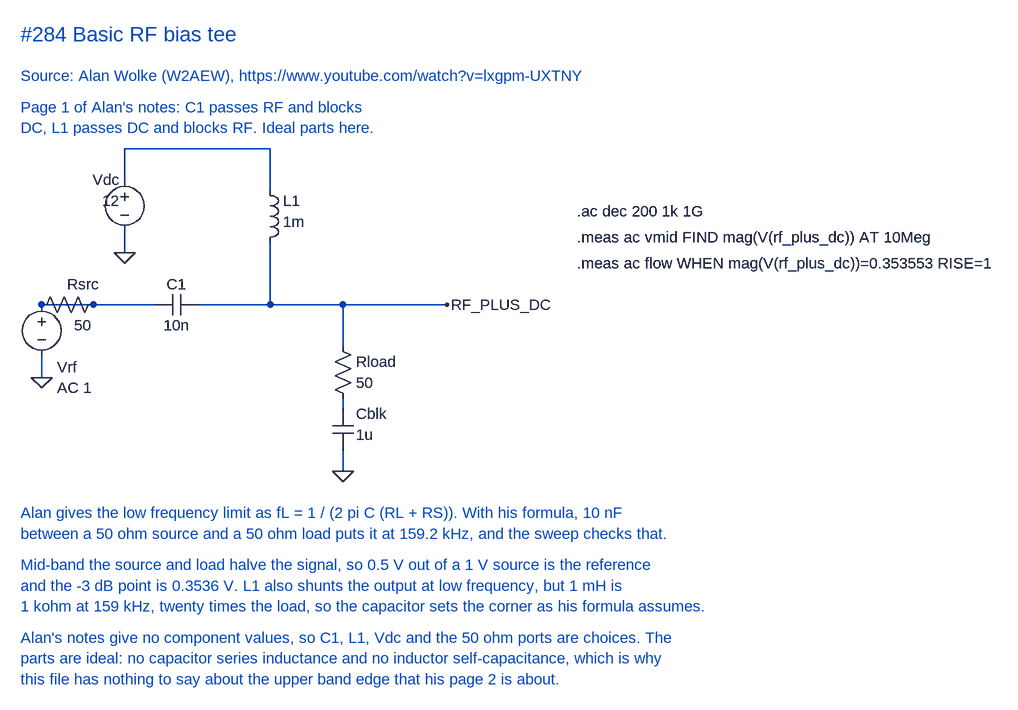
[diagram p0: schematic Basic bias tee.asc]
Basic bias tee.asc, the LTspice schematic file:
Version 4
SHEET 1 1300 800
WIRE 176 304 256 304
WIRE 176 384 176 416
WIRE 304 112 304 64
WIRE 304 64 528 64
WIRE 528 64 528 128
WIRE 528 208 528 304
WIRE 304 192 304 224
WIRE 256 304 352 304
WIRE 416 304 800 304
WIRE 640 304 640 352
WIRE 640 352 640 368
WIRE 640 448 640 464
WIRE 640 528 640 560
FLAG 176 416 0
FLAG 304 224 0
FLAG 640 560 0
FLAG 800 304 RF_PLUS_DC
SYMBOL voltage 176 288 R0
WINDOW 0 24 112 Left 2
WINDOW 3 24 144 Left 2
SYMATTR InstName Vrf
SYMATTR Value AC 1
SYMBOL res 272 288 R90
WINDOW 0 0 32 VBottom 2
WINDOW 3 32 32 VTop 2
SYMATTR InstName Rsrc
SYMATTR Value 50
SYMBOL cap 416 288 R90
WINDOW 0 0 32 VBottom 2
WINDOW 3 32 32 VTop 2
SYMATTR InstName C1
SYMATTR Value 10n
SYMBOL ind 512 112 R0
WINDOW 0 36 32 Left 2
WINDOW 3 36 64 Left 2
SYMATTR InstName L1
SYMATTR Value 1m
SYMBOL voltage 304 96 R0
WINDOW 0 -8 16 Right 2
WINDOW 3 -8 48 Right 2
SYMATTR InstName Vdc
SYMATTR Value 12
SYMBOL res 624 352 R0
WINDOW 0 36 40 Left 2
WINDOW 3 36 72 Left 2
SYMATTR InstName Rload
SYMATTR Value 50
SYMBOL cap 624 464 R0
WINDOW 0 36 8 Left 2
WINDOW 3 36 40 Left 2
SYMATTR InstName Cblk
SYMATTR Value 1u
TEXT 144 -112 Left 3 ;#284 Basic RF bias tee
TEXT 144 -48 Left 2 ;Source: Alan Wolke (W2AEW), https://www.youtube.com/watch?v=lxgpm-UXTNY
TEXT 144 0 Left 2 ;Page 1 of Alan's notes: C1 passes RF and blocks
TEXT 144 32 Left 2 ;DC, L1 passes DC and blocks RF. Ideal parts here.
TEXT 144 624 Left 2 ;Alan gives the low frequency limit as fL = 1 / (2 pi C (RL + RS)). With his formula, 10 nF
TEXT 144 656 Left 2 ;between a 50 ohm source and a 50 ohm load puts it at 159.2 kHz, and the sweep checks that.
TEXT 144 704 Left 2 ;Mid-band the source and load halve the signal, so 0.5 V out of a 1 V source is the reference
TEXT 144 736 Left 2 ;and the -3 dB point is 0.3536 V. L1 also shunts the output at low frequency, but 1 mH is
TEXT 144 768 Left 2 ;1 kohm at 159 kHz, twenty times the load, so the capacitor sets the corner as his formula assumes.
TEXT 144 816 Left 2 ;Alan's notes give no component values, so C1, L1, Vdc and the 50 ohm ports are choices. The
TEXT 144 848 Left 2 ;parts are ideal: no capacitor series inductance and no inductor self-capacitance, which is why
TEXT 144 880 Left 2 ;this file has nothing to say about the upper band edge that his page 2 is about.
TEXT 1000 160 Left 2 !.ac dec 200 1k 1G
TEXT 1000 200 Left 2 !.meas ac vmid FIND mag(V(rf_plus_dc)) AT 10Meg
TEXT 1000 240 Left 2 !.meas ac flow WHEN mag(V(rf_plus_dc))=0.353553 RISE=1

The netlist it stands for:
* Basic bias tee.asc
Vrf N001 0 AC 1
Rsrc N001 N001 50
C1 RF_PLUS_DC N001 10n
L1 N002 RF_PLUS_DC 1m
Vdc N002 0 12
Rload RF_PLUS_DC N003 50
Cblk N003 0 1u
* #284 Basic RF bias tee
* Source: Alan Wolke (W2AEW), https://www.youtube.com/watch?v=lxgpm-UXTNY
* Page 1 of Alan's notes: C1 passes RF and blocks
* DC, L1 passes DC and blocks RF. Ideal parts here.
* Alan gives the low frequency limit as fL = 1 / (2 pi C (RL + RS)). With his formula, 10 nF
* between a 50 ohm source and a 50 ohm load puts it at 159.2 kHz, and the sweep checks that.
* Mid-band the source and load halve the signal, so 0.5 V out of a 1 V source is the reference
* and the -3 dB point is 0.3536 V. L1 also shunts the output at low frequency, but 1 mH is
* 1 kohm at 159 kHz, twenty times the load, so the capacitor sets the corner as his formula assumes.
* Alan's notes give no component values, so C1, L1, Vdc and the 50 ohm ports are choices. The
* parts are ideal: no capacitor series inductance and no inductor self-capacitance, which is why
* this file has nothing to say about the upper band edge that his page 2 is about.
.ac dec 200 1k 1G
.meas ac vmid FIND mag(V(rf_plus_dc)) AT 10Meg
.meas ac flow WHEN mag(V(rf_plus_dc))=0.353553 RISE=1
.backanno
.end